# Altium project EFOLD_VESC_V1.PrjPcb
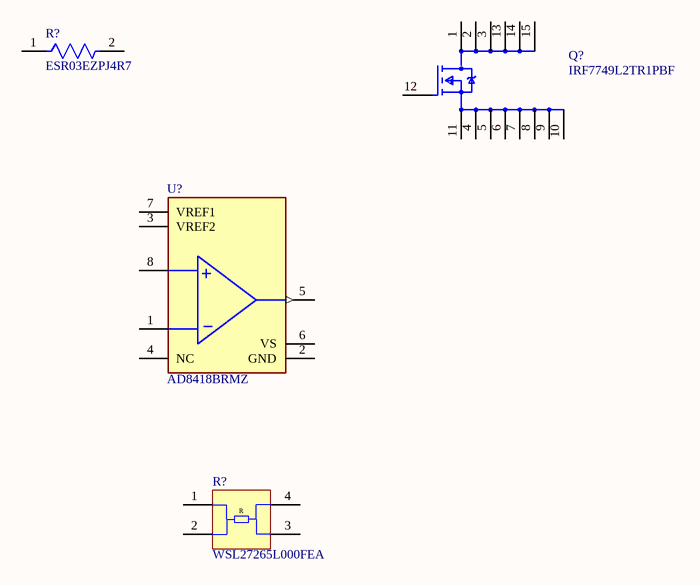
[diagram p0: Sheet4.SchDoc]
1 sheet, 4 parts. Net scope: global (net labels, ports and power ports of the same name join across sheets).

## Sheet Sheet4.SchDoc
size A2; SheetNumber: 4; SheetTotal: 5

### Parts
(Parts that share a designator on the sheet are numbered #1, #2 ... from top to bottom, then left to right.)
Q?  IRF7749L2TR1PBF  [FP-MG-WDSON-11-MFG]
R?#1  ESR03EZPJ4R7  [FP-ESR03-MFG]
R?#2  WSL27265L000FEA  [VISH-WSL27263_4_5L-4_V]
U?  AD8418BRMZ  [FP-RM-8-IPC_C]

### Nets

Not connected (* = marked no-connect by the designer): Q? 1(D) 2(D) 3(D) 4(S) 5(S) 6(S) 7(S) 8(S) 9(S) 10(S) 11(S) 12(G) 13(D) 14(D) 15(D); R?#1 1 2; R?#2 1 2 3 4; U? 1(-IN) 2(GND) 3(VREF2) 4(NC) 5(OUT) 6(VS) 7(VREF1) 8(+IN)

### Notes on the sheet
- (in symbol CMP-1343-00005-1) R

### Library data of the parts
Q? = CMP-00196-74197353-1: IRF7749L2TR1PBF Trans MOSFET N-CH 60V 200A 15-Pin Direct-FET L8 T/R; Max Junction Temperature (Tj): 175°C; Resistance: 1.5MΩ; Element Configuration: Single; Fall Time: 39ns; Turn-Off Delay Time: 72ns; Max Power Dissipation: 3.3W; Recovery Time: 68ns; Nominal Vgs: 2.9V; Power Dissipation: 125W; Gate to Source Voltage (Vgs): 20V; Turn-On Delay Time: 17ns; Input Capacitance: 12.32nF; Number of Elements: 1; Drain to Source Resistance: 1.1mΩ; Rise Time: 43ns; Height: 508µm; REACH SVHC: No SVHC; RoHS: Compliant; Rds On Max: 1.5mΩ; Drain to Source Voltage (Vdss): 60V; Mount: Surface Mount; Number of Pins: 11; Packaging: Cut Tape; Width: 7.1mm; Radiation Hardening: No; Min Operating Temperature: -55°C; Drain to Source Breakdown Voltage: 60V; Threshold Voltage: 2.9V; Continuous Drain Current (ID): 200A; NexarPartId: 74197353; Max Operating Temperature: 175°C; Length: 9.144mm; Number of Channels: 1; Lead Free: Lead Free
R?#1 = CMP-08839-028336-1: 4.7Ω ±5% 0.25W 0603 Anti-Surge Chip Resistor AEC-Q200; Temperature Coefficient: 200ppm/°C; Max Power Dissipation: 250mW; Resistance: 4.7R; Package Quantity: 5000; Number of Terminations: 2; Case/Package: 0603; Length: 0.063inch; Width: 0.031inch; Tolerance: 5%; Max Operating Temperature: 155°C; Resistor Type: Thick Film; Case Code (Imperial): 0603; Case Code (Metric): 1608; Min Operating Temperature: -55°C; Packaging: Cut Tape; Height: 0.022inch; Series: ESR; Features: Automotive AEC-Q200
R?#2 = CMP-1343-00005-1: Power Metal Strip Resistor, 5 mOhm, +/-1 % Tolerance, 3 W, -65 to 170 degC, 4-Pin 6.9 x 6.6 x 2.79 mm SMD, RoHS, Tape and Reel; Manufacturer: Vishay Semiconductor; Resistance: 5 mOhm; Power Rating: 3 W; Temperature coefficient: +/-75 ppm/degC; Tolerance: +/-1.0%; ComponentLink1Description: Manufacturer URL; Mounting Technology: Surface Mount; PackageDescription: 4-Pin Surface Mount Device, Body 6.9 x 6.6 mm, Height 2.99 mm; RoHS: TRUE; PartNumber: WSL27265L000FEA; ComponentLink2Description: Datasheet; Packing: Tape and Reel; DatasheetVersion: 17-Dec-14; ComponentLink1URL: http://www.vishay.com/; ComponentLink3Description: Package Specification; ComponentLink2URL: http://www.vishay.com/docs/30131/wsl2726.pdf; Temperature Range: -65 to 170 degC; ComponentLink3URL: http://www.vishay.com/docs/30131/wsl2726.pdf
U? = CMP-09116-000026-1: IC CURR SENSE 1 CIRCUIT 8MSOP; Manufacturer: Analog Devices; Min Supply Voltage: 2.7V; Input Bias Current: 130uA; Number Of Channels: 1; Max Supply Voltage: 5.5V; Voltage Gain: 0.02V/mV; Bandwidth: 250kHz; Standoff Height: 0.05mm; Nominal Supply Current: 2.6mA; Input Offset Voltage: 0.2mV; Automotive: No; Temperature: -40°C to +125°C; Octopart: https://octopart.com/ad8418brmz-analog+devices-21054230; ComponentLink2Description: Datasheet; Device Class L1: Integrated Circuits (ICs); ComponentLink2URL: https://www.analog.com/media/en/technical-documentation/data-sheets/AD8418.pdf; Digikey Description: IC CURR SENSE 1 CIRCUIT 8MSOP; Ipc Land Pattern Name: SOP65P490X110-8; Temperature Range Low: -40°C; Device Class L3: Instrumentation; Height: 1.1mm; Mouser Description: Current Sense Amplifier, Bidirectional, 1, 130 A, MSOP, 8, -40 C, 125 C; Lead Free: Yes; Manufacturer Part Number: AD8418BRMZ; Category: IC; Package: RM-8; Device Class L2: Linear ICs; Temperature Range High: +125°C; RoHS: TRUE